# Altium schematic sheet 03_Sensors.SchDoc
size A4; SheetNumber: 4; SheetTotal: 6
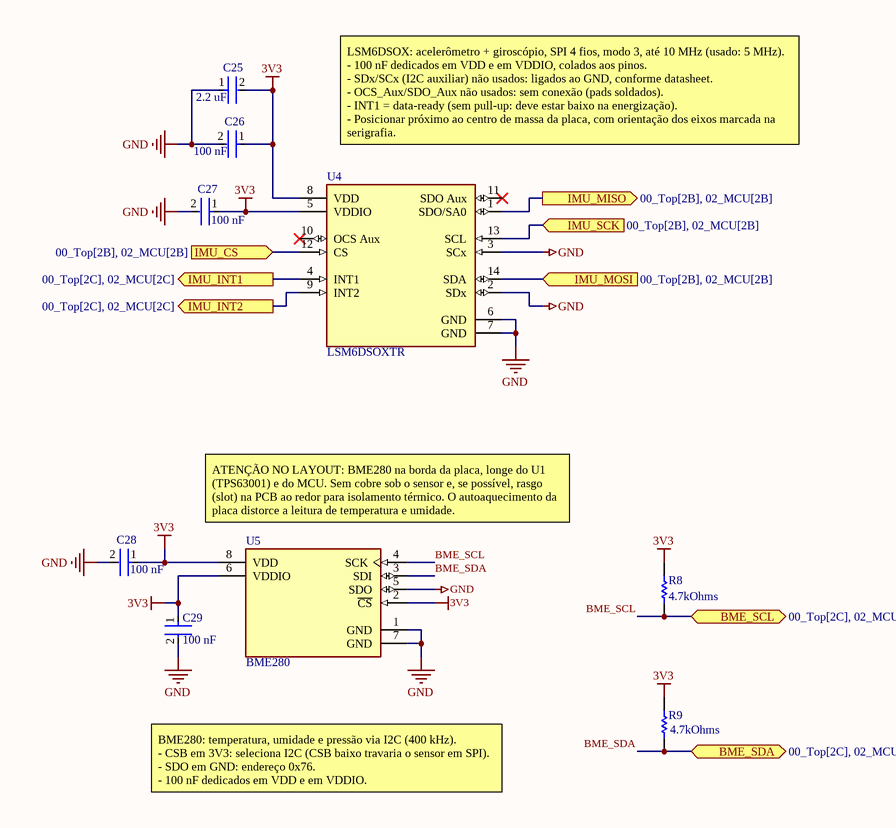
[diagram p0: 03_Sensors.SchDoc, left]

## Parts
C25  value 2.2 uF  [FP-CC0603-DA-MFG]  (hidden comment: CC0603KRX7R7BB225)
C26  Capacitance: 100 nF  [FP-CC0603-DA-MFG]  (hidden comment: CC0603KRX7R9BB104)
C27  Capacitance: 100 nF  [FP-CC0603-DA-MFG]  (hidden comment: CC0603KRX7R9BB104)
C28  Capacitance: 100 nF  [FP-CC0603-DA-MFG]  (hidden comment: CC0603KRX7R9BB104)
C29  Capacitance: 100 nF  [FP-CC0603-DA-MFG]  (hidden comment: CC0603KRX7R9BB104)
R8  Resistance: 4.7kOhms  [RESC1608X55X25LL10T15]  (hidden comment: RC0603FR-074K7L)
R9  Resistance: 4.7kOhms  [RESC1608X55X25LL10T15]  (hidden comment: RC0603FR-074K7L)
U4  LSM6DSOXTR  [FP-LGA-14L-DM00249496-MFG]
U5  BME280  [FP-BME280-MFG]

## Ports
BME_SCL (bidir, see 00_Top[2C], 02_MCU[3A]), BME_SDA (bidir, see 00_Top[2C], 02_MCU[3A]), IMU_CS (in, see 00_Top[2B], 02_MCU[2B]), IMU_INT1 (out, see 00_Top[2C], 02_MCU[2C]), IMU_INT2 (out, see 00_Top[2C], 02_MCU[2C]), IMU_MISO (out, see 00_Top[2B], 02_MCU[2B]), IMU_MOSI (in, see 00_Top[2B], 02_MCU[2B]), IMU_SCK (in, see 00_Top[2B], 02_MCU[2B])

## Nets
3V3: C25.2 C26.1 C27.1 C28.1 C29.1 R8.2 R9.1 U4.5(VDDIO) U4.8(VDD) U5.2(~{CS}) U5.6(VDDIO) U5.8(VDD)
GND: C25.1 C26.2 C27.2 C28.2 C29.2 U4.2(SDx) U4.3(SCx) U4.6(GND) U4.7(GND) U5.1(GND) U5.5(SDO) U5.7(GND)
BME_SCL: R8.1 U5.4(SCK) ; port BME_SCL
BME_SDA: R9.2 U5.3(SDI) ; port BME_SDA
IMU_CS: U4.12(CS) ; port IMU_CS
IMU_INT1: U4.4(INT1) ; port IMU_INT1
IMU_INT2: U4.9(INT2) ; port IMU_INT2
IMU_MISO: U4.1(SDO/SA0) ; port IMU_MISO
IMU_MOSI: U4.14(SDA) ; port IMU_MOSI
IMU_SCK: U4.13(SCL) ; port IMU_SCK

Not connected (* = marked no-connect by the designer): U4 10(OCS_Aux)* 11(SDO_Aux)*

## Notes on the sheet
- LSM6DSOX: acelerômetro + giroscópio, SPI 4 fios, modo 3, até 10 MHz (usado: 5 MHz).
  - 100 nF dedicados em VDD e em VDDIO, colados aos pinos.
  - SDx/SCx (I2C auxiliar) não usados: ligados ao GND, conforme datasheet.
  - OCS_Aux/SDO_Aux não usados: sem conexão (pads soldados).
  - INT1 = data-ready (sem pull-up: deve estar baixo na energização).
  - Posicionar próximo ao centro de massa da placa, com orientação dos eixos marcada na serigrafia.
- (near U5) ATENÇÃO NO LAYOUT: BME280 na borda da placa, longe do U1 (TPS63001) e do MCU. Sem cobre sob o sensor e, se possível, rasgo (slot) na PCB ao redor para isolamento térmico. O autoaquecimento da placa distorce a leitura de temperatura e umidade.
- BME280: temperatura, umidade e pressão via I2C (400 kHz).
  - CSB em 3V3: seleciona I2C (CSB baixo travaria o sensor em SPI).
  - SDO em GND: endereço 0x76.
  - 100 nF dedicados em VDD e em VDDIO.

## Library data of the parts
C25 = CMP-03422-001238-1: CAP CER 2.2UF 16V X7R 0603; Manufacturer: YAGEO; Temperature Coefficient: 15%; Material: Ceramic; Tolerance: 0.1; Voltage: 16 V; Temperature Range High: +125°C; Digikey Description: CAP CER 2.2UF 16V X7R 0603; Temperature: -55°C to +125°C; Lead Free: Yes; Capacitance: 2.2 uF; Package: CC0603-DA; ComponentLink2URL: http://www.yageo.com/documents/recent/UPY-GPHC_X7R_6.3V-to-50V_18.pdf; Device Class L1: Passive Components; Category: Cap; Manufacturer Part Number: CC0603KRX7R7BB225; ComponentLink2Description: Datasheet; Mouser Description: Cap Ceramic 2.2uF 16V X7R 10% Pad SMD 0603 125C Automotive T/R; Device Class L2: Capacitors; RoHS: TRUE; Automotive: No; Voltage Rating: 16 V; Device Class L3: Ceramic Capacitors; Temperature Range Low: -55°C; Height: 0.9mm; Footprint Url: http://www.yageo.com/exep/pages/download/literatures/UPY-C_GEN_24.pdf; Temperature Characteristic: X7R; Octopart: https://octopart.com/cc0603krx7r7bb225-yageo-67146440
C26-C29 = CMP-2100-03601-2: CAP CER 0.1UF 50V X7R 0603; Manufacturer: YAGEO; Material: Ceramic; Temperature Coefficient: 15%; Tolerance: 0.1; Value: 100 nF; Height: 0.9mm; Voltage: 50 V; ComponentLink2Description: Datasheet; Device Class L2: Capacitors; Temperature Range High: +125°C; Category: Cap; Footprint Url: http://www.yageo.com/exep/pages/download/literatures/UPY-C_GEN_24.pdf; ComponentLink2URL: http://www.yageo.com/documents/recent/UPY-GPHC_X7R_6.3V-to-50V_18.pdf; Package: CC0603-DA; Temperature: -55°C to +125°C; Voltage Rating: 50 V; Temperature Characteristic: X7R; Device Class L1: Passive Components; Temperature Range Low: -55°C; Manufacturer Part Number: CC0603KRX7R9BB104; RoHS: TRUE; Automotive: No; Device Class L3: Ceramic Capacitors; Octopart: https://octopart.com/cc0603krx7r9bb104-yageo-42244635; Mouser Description: Multilayer Ceramic Capacitor, CC Series, 0.1 - F, - 10%, X7R, 50 V, 0603 [1608 Metric]; Lead Free: Yes; Digikey Description: CAP CER 0.1UF 50V X7R 0603
R8 R9 = CMP-2000-06942-1: Chip Resistor, 4.7 KOhm, +/- 1%, 0.1 W, -55 to 155 degC, 0603 (1608 Metric), RoHS, Tape and Reel; Manufacturer: Yageo; Power Rating: 100mW; Temperature Coefficient: 100PPM/C; Voltage Rating: 50V; Package Reference: 0603; Series: RC; Datasheet Version: Rev. 7, 05/2017; Packaging: Reel; Termination Style: SMD/SMT; Datasheet URL: http://www.yageo.com/documents/recent/PYu-RC_Group_51_RoHS_L_7.pdf; Manufacturer URL: http://www.yageo.com/; Package Description: 2-Pin Surface Mount Device, Body 1.6 x 0.8 mm; Case Code - mm: 1608; Case Code - in: 0603; Mounting Technology: SurfaceMount; Operating Temperature Range: -55Cto+155C; Tolerance: 1%; Product: ThickFilmResistorsGeneralPurpose
U4 = CMP-12177-000010-1: INEMO INERTIAL MODULE: 3D ACCELE; Manufacturer: STMicroelectronics; Sensor Type: Temperature,Accelerometer,Gyroscope; Accel Range: 2/4/8/16g; Accel Sensitivity: 0.061/0.122/0.244/0.488mV/g; Operating Supply Current: 0.55mA; Gyro Range: 125/250/500/1000/2000°/s; Gyro Sensitivity: 4.375/8.75/17.5/35/70LSB/°/s; Sensor Output: I2C,SPI,Other; Min Supply Voltage: 1.62V; Max Supply Voltage: 3.6V; Octopart: https://octopart.com/lsm6dsoxtr-stmicroelectronics-98102600; Package: LGA-14L-DM00249496; Footprint Url: https://www.st.com/content/ccc/resource/technical/document/technical_note/73/17/9c/16/dd/96/4a/01/CD00134799.pdf/files/CD00134799.pdf/jcr:content/translations/en.CD00134799.pdf; ComponentLink2Description: Datasheet; Mouser Description: LSM6DSOX: 3.6 V 3 Axis Accelerometer Gyroscope iNEMO Inertial Module - LGA-14L; ComponentLink2URL: https://www.st.com/resource/en/datasheet/lsm6dsox.pdf; Temperature Range Low: -40°C; Digikey Description: INEMO INERTIAL MODULE: 3D ACCELE; Lead Free: Yes; Device Class L3: Inertial Measurement Units (IMUs); Category: IC; Device Class L2: Motion Sensors; RoHS: TRUE; Temperature: -40°C to +85°C; Height: 0.86mm; Device Class L1: Sensors; Temperature Range High: +85°C; Manufacturer Part Number: LSM6DSOXTR; Automotive: No
U5 = CMP-2000-05073-3: SENSOR PRESSURE HUMIDITY TEMP; Sensor Type: Temperature; Accuracy: 3%; Response Time: 1s; Output Type: SPI; Min Operating Temperature: -40°C; Max Operating Temperature: 85°C; Case/Package: LGA; Packaging: Cut Tape; Mount: Surface Mount; Lead Free: Lead Free; Number of Pins: 8